# Altium schematic sheet PL_IO.SchDoc
size A4; SheetNumber: 1; SheetTotal: 11
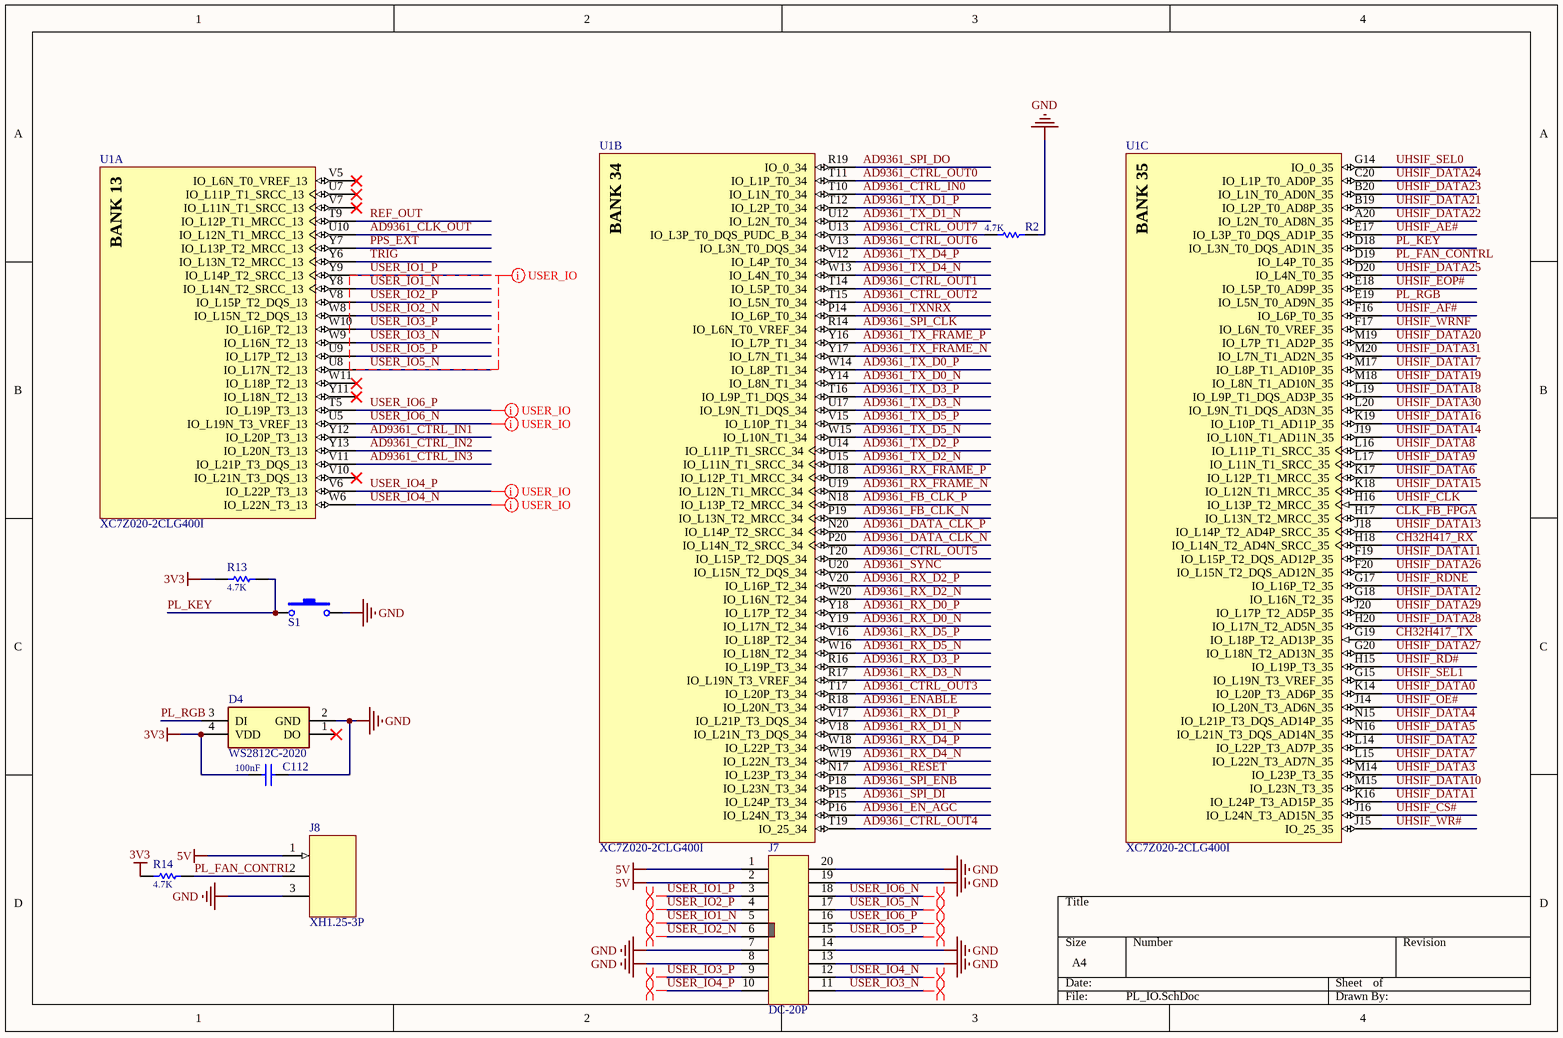
[diagram p0: PL_IO.SchDoc]

## Parts
C112  value 100nF  [C0402-L]  (hidden comment: Cap-S)
D4  WS2812C-2020  [WS2812C2020]
J7  DC-20P  [HDR-TH_20P-P2.54-V-M-R2-C10-S2.54]
J8  XH1.25-3P  [CONN-TH_3P-P1.25_CAX_1.25-3A]
R2  value 4.7K  [R0402-L]  (hidden comment: R)
R13  value 4.7K  [R0402-L]  (hidden comment: R)
R14  value 4.7K  [R0402-L]  (hidden comment: R)
S1  SW-PB2  [SW-PB2-SMD]  (value not drawn)
U1  XC7Z020-2CLG400I  [CLG400]  (parts A,B,C of 9)

## Nets
3V3: C112.1 D4.4(VDD) R13.1 R14.1
5V: J7.1 J7.2 J8.1
GND: C112.2 D4.2(GND) J7.7 J7.8 J7.13 J7.14 J7.19 J7.20 J8.3 R2.1 S1.2
AD9361_CLK_OUT: U1.U10(IO_L12N_T1_MRCC_13)
AD9361_CTRL_IN0: U1.T10(IO_L1N_T0_34)
AD9361_CTRL_IN1: U1.Y12(IO_L20P_T3_13)
AD9361_CTRL_IN2: U1.Y13(IO_L20N_T3_13)
AD9361_CTRL_IN3: U1.V11(IO_L21P_T3_DQS_13)
AD9361_CTRL_OUT0: U1.T11(IO_L1P_T0_34)
AD9361_CTRL_OUT1: U1.T14(IO_L5P_T0_34)
AD9361_CTRL_OUT2: U1.T15(IO_L5N_T0_34)
AD9361_CTRL_OUT3: U1.T17(IO_L20P_T3_34)
AD9361_CTRL_OUT4: U1.T19(IO_25_34)
AD9361_CTRL_OUT5: U1.T20(IO_L15P_T2_DQS_34)
AD9361_CTRL_OUT6: U1.V13(IO_L3N_T0_DQS_34)
AD9361_CTRL_OUT7: R2.2 U1.U13(IO_L3P_T0_DQS_PUDC_B_34)
AD9361_DATA_CLK_N: U1.P20(IO_L14N_T2_SRCC_34)
AD9361_DATA_CLK_P: U1.N20(IO_L14P_T2_SRCC_34)
AD9361_EN_AGC: U1.P16(IO_L24N_T3_34)
AD9361_ENABLE: U1.R18(IO_L20N_T3_34)
AD9361_FB_CLK_N: U1.P19(IO_L13N_T2_MRCC_34)
AD9361_FB_CLK_P: U1.N18(IO_L13P_T2_MRCC_34)
AD9361_RESET: U1.N17(IO_L23P_T3_34)
AD9361_RX_D0_N: U1.Y19(IO_L17N_T2_34)
AD9361_RX_D0_P: U1.Y18(IO_L17P_T2_34)
AD9361_RX_D1_N: U1.V18(IO_L21N_T3_DQS_34)
AD9361_RX_D1_P: U1.V17(IO_L21P_T3_DQS_34)
AD9361_RX_D2_N: U1.W20(IO_L16N_T2_34)
AD9361_RX_D2_P: U1.V20(IO_L16P_T2_34)
AD9361_RX_D3_N: U1.R17(IO_L19N_T3_VREF_34)
AD9361_RX_D3_P: U1.R16(IO_L19P_T3_34)
AD9361_RX_D4_N: U1.W19(IO_L22N_T3_34)
AD9361_RX_D4_P: U1.W18(IO_L22P_T3_34)
AD9361_RX_D5_N: U1.W16(IO_L18N_T2_34)
AD9361_RX_D5_P: U1.V16(IO_L18P_T2_34)
AD9361_RX_FRAME_N: U1.U19(IO_L12N_T1_MRCC_34)
AD9361_RX_FRAME_P: U1.U18(IO_L12P_T1_MRCC_34)
AD9361_SPI_CLK: U1.R14(IO_L6N_T0_VREF_34)
AD9361_SPI_DI: U1.P15(IO_L24P_T3_34)
AD9361_SPI_DO: U1.R19(IO_0_34)
AD9361_SPI_ENB: U1.P18(IO_L23N_T3_34)
AD9361_SYNC: U1.U20(IO_L15N_T2_DQS_34)
AD9361_TX_D0_N: U1.Y14(IO_L8N_T1_34)
AD9361_TX_D0_P: U1.W14(IO_L8P_T1_34)
AD9361_TX_D1_N: U1.U12(IO_L2N_T0_34)
AD9361_TX_D1_P: U1.T12(IO_L2P_T0_34)
AD9361_TX_D2_N: U1.U15(IO_L11N_T1_SRCC_34)
AD9361_TX_D2_P: U1.U14(IO_L11P_T1_SRCC_34)
AD9361_TX_D3_N: U1.U17(IO_L9N_T1_DQS_34)
AD9361_TX_D3_P: U1.T16(IO_L9P_T1_DQS_34)
AD9361_TX_D4_N: U1.W13(IO_L4N_T0_34)
AD9361_TX_D4_P: U1.V12(IO_L4P_T0_34)
AD9361_TX_D5_N: U1.W15(IO_L10N_T1_34)
AD9361_TX_D5_P: U1.V15(IO_L10P_T1_34)
AD9361_TX_FRAME_N: U1.Y17(IO_L7N_T1_34)
AD9361_TX_FRAME_P: U1.Y16(IO_L7P_T1_34)
AD9361_TXNRX: U1.P14(IO_L6P_T0_34)
CH32H417_RX: U1.H18(IO_L14N_T2_AD4N_SRCC_35)
CH32H417_TX: U1.G19(IO_L18P_T2_AD13P_35)
CLK_FB_FPGA: U1.H17(IO_L13N_T2_MRCC_35)
PL_FAN_CONTRL: J8.2 R14.2 U1.D19(IO_L4P_T0_35)
PL_KEY: R13.2 S1.1 U1.D18(IO_L3N_T0_DQS_AD1N_35)
PL_RGB: D4.3(DI) U1.E19(IO_L5N_T0_AD9N_35)
PPS_EXT: U1.Y7(IO_L13P_T2_MRCC_13)
REF_OUT: U1.T9(IO_L12P_T1_MRCC_13)
TRIG: U1.Y6(IO_L13N_T2_MRCC_13)
UHSIF_AE#: U1.E17(IO_L3P_T0_DQS_AD1P_35)
UHSIF_AF#: U1.F16(IO_L6P_T0_35)
UHSIF_CLK: U1.H16(IO_L13P_T2_MRCC_35)
UHSIF_CS#: U1.J16(IO_L24N_T3_AD15N_35)
UHSIF_DATA0: U1.K14(IO_L20P_T3_AD6P_35)
UHSIF_DATA1: U1.K16(IO_L24P_T3_AD15P_35)
UHSIF_DATA2: U1.L14(IO_L22P_T3_AD7P_35)
UHSIF_DATA3: U1.M14(IO_L23P_T3_35)
UHSIF_DATA4: U1.N15(IO_L21P_T3_DQS_AD14P_35)
UHSIF_DATA5: U1.N16(IO_L21N_T3_DQS_AD14N_35)
UHSIF_DATA6: U1.K17(IO_L12P_T1_MRCC_35)
UHSIF_DATA7: U1.L15(IO_L22N_T3_AD7N_35)
UHSIF_DATA8: U1.L16(IO_L11P_T1_SRCC_35)
UHSIF_DATA9: U1.L17(IO_L11N_T1_SRCC_35)
UHSIF_DATA10: U1.M15(IO_L23N_T3_35)
UHSIF_DATA11: U1.F19(IO_L15P_T2_DQS_AD12P_35)
UHSIF_DATA12: U1.G18(IO_L16N_T2_35)
UHSIF_DATA13: U1.J18(IO_L14P_T2_AD4P_SRCC_35)
UHSIF_DATA14: U1.J19(IO_L10N_T1_AD11N_35)
UHSIF_DATA15: U1.K18(IO_L12N_T1_MRCC_35)
UHSIF_DATA16: U1.K19(IO_L10P_T1_AD11P_35)
UHSIF_DATA17: U1.M17(IO_L8P_T1_AD10P_35)
UHSIF_DATA18: U1.L19(IO_L9P_T1_DQS_AD3P_35)
UHSIF_DATA19: U1.M18(IO_L8N_T1_AD10N_35)
UHSIF_DATA20: U1.M19(IO_L7P_T1_AD2P_35)
UHSIF_DATA21: U1.B19(IO_L2P_T0_AD8P_35)
UHSIF_DATA22: U1.A20(IO_L2N_T0_AD8N_35)
UHSIF_DATA23: U1.B20(IO_L1N_T0_AD0N_35)
UHSIF_DATA24: U1.C20(IO_L1P_T0_AD0P_35)
UHSIF_DATA25: U1.D20(IO_L4N_T0_35)
UHSIF_DATA26: U1.F20(IO_L15N_T2_DQS_AD12N_35)
UHSIF_DATA27: U1.G20(IO_L18N_T2_AD13N_35)
UHSIF_DATA28: U1.H20(IO_L17N_T2_AD5N_35)
UHSIF_DATA29: U1.J20(IO_L17P_T2_AD5P_35)
UHSIF_DATA30: U1.L20(IO_L9N_T1_DQS_AD3N_35)
UHSIF_DATA31: U1.M20(IO_L7N_T1_AD2N_35)
UHSIF_EOP#: U1.E18(IO_L5P_T0_AD9P_35)
UHSIF_OE#: U1.J14(IO_L20N_T3_AD6N_35)
UHSIF_RD#: U1.H15(IO_L19P_T3_35)
UHSIF_RDNE: U1.G17(IO_L16P_T2_35)
UHSIF_SEL0: U1.G14(IO_0_35)
UHSIF_SEL1: U1.G15(IO_L19N_T3_VREF_35)
UHSIF_WR#: U1.J15(IO_25_35)
UHSIF_WRNF: U1.F17(IO_L6N_T0_VREF_35)
USER_IO1_N: J7.5 U1.Y8(IO_L14N_T2_SRCC_13)
USER_IO1_P: J7.3 U1.Y9(IO_L14P_T2_SRCC_13)
USER_IO2_N: J7.6 U1.W8(IO_L15N_T2_DQS_13)
USER_IO2_P: J7.4 U1.V8(IO_L15P_T2_DQS_13)
USER_IO3_N: J7.11 U1.W9(IO_L16N_T2_13)
USER_IO3_P: J7.9 U1.W10(IO_L16P_T2_13)
USER_IO4_N: J7.12 U1.W6(IO_L22N_T3_13)
USER_IO4_P: J7.10 U1.V6(IO_L22P_T3_13)
USER_IO5_N: J7.17 U1.U8(IO_L17N_T2_13)
USER_IO5_P: J7.15 U1.U9(IO_L17P_T2_13)
USER_IO6_N: J7.18 U1.U5(IO_L19N_T3_VREF_13)
USER_IO6_P: J7.16 U1.T5(IO_L19P_T3_13)

Not connected (* = marked no-connect by the designer): D4 1(DO)*; U1 U7(IO_L11P_T1_SRCC_13)* V5(IO_L6N_T0_VREF_13)* V7(IO_L11N_T1_SRCC_13)* V10(IO_L21N_T3_DQS_13)* W11(IO_L18P_T2_13)* Y11(IO_L18N_T2_13)*

## Layout directives
net class USER_IO: USER_IO1_N, USER_IO1_P, USER_IO2_N, USER_IO2_P, USER_IO3_N, USER_IO3_P, USER_IO4_N, USER_IO4_P, USER_IO5_N, USER_IO5_P, USER_IO6_N, USER_IO6_P
differential pair: USER_IO1_N, USER_IO1_P, USER_IO2_N, USER_IO2_P, USER_IO3_N, USER_IO3_P, USER_IO4_N, USER_IO4_P, USER_IO5_N, USER_IO5_P, USER_IO6_N, USER_IO6_P

## Notes on the sheet
- (in symbol CMP-0363-00003-3, part A) BANK 13
- (in symbol CMP-0363-00003-3, part B) BANK 34
- (in symbol CMP-0363-00003-3, part C) BANK 35

## Library data of the parts
C112 = Cap-S: 贴片瓷片电容
D4 = WS2812C-2020: Intelligent control LED integrated light source; Manufacturer_Name: Worldsemi; Geometry.Height: 0.84mm; Manufacturer_Part_Number: WS2812C-2020; Mouser Part Number: *; Mouser Price/Stock: *; Arrow Part Number: *; Arrow Price/Stock: *; Datasheet Link: http://www.world-semi.com/DownLoadFile/139
R2 R13 R14 = Res: 贴片电阻
S1 = SW-PB2: 贴片式2脚微动开关
U1 = CMP-0363-00003-3: 733 MHz Zynq™-7000 AP SoC, 130 PS I/O, 125 FPGA I/O, 400-Ball BGA, Speed Grade 2, Industrial Grade, Pb-Free; LUTs: 53200; Flip Flops: 106400; Speed Grade: -2; Extensible Block RAM (# 36Kb Blocks): 560 KB (140); ComponentLink2URL: http://www.xilinx.com/support/documentation/user_guides/ug865-Zynq-7000-Pkg-Pinout.pdf; ComponentLink1Description: Datasheet; PartNumber: XC7Z020-2CLG400I; ComponentLink3URL: http://www.xilinx.com/support/documentation/data_sheets/ds187-XC7Z010-XC7Z020-Data-Sheet.pdf; Mounting Technology: Surface Mount; ComponentLink6Description: PCB and Layout Guide; ComponentLink3Description: DC and AC Switching Characteristics; ComponentLink4Description: Package File; PackageVersion: Rev 1.1, 09/2012; ComponentLink6URL: http://www.xilinx.com/support/documentation/user_guides/ug483_7Series_PCB.pdf; PackageDescription: Wire-Bond Chip-Scale BGA, Body 17 x 17 mm, 0.8 mm Pitch; ComponentLink5Description: Packaging and Pinout; Generic Part Number: XC7Z020; RoHS: Pb-Free; PackageReference: CLG400; ComponentLink1URL: http://www.xilinx.com/support/documentation/data_sheets/ds190-Zynq-7000-Overview.pdf; ComponentLink2Description: Package Specification; ComponentLink5URL: http://www.xilinx.com/support/documentation/user_guides/ug865-Zynq-7000-Pkg-Pinout.pdf; DatasheetVersion: v1.2; ComponentLink4URL: http://www.xilinx.com/support/packagefiles/z7packages/xc7z020clg400pkg.txt; Code_JEDEC: MO-275-MMAA-1